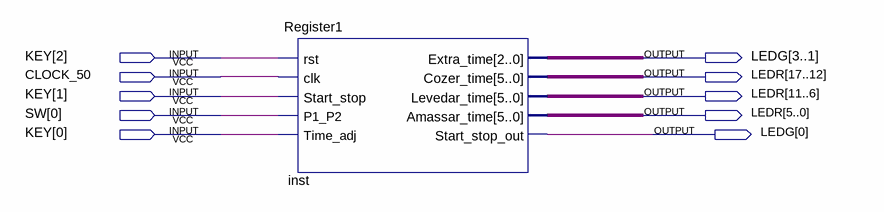
[diagram p0: schematic sheet]
// Quartus schematic Register_Demo.bdf as structural Verilog: 1 symbols, 10 pins
module Register_Demo (
  input  [2:0] KEY,
  input  CLOCK_50,
  input  [0:0] SW,
  output [3:0] LEDG,
  output [17:0] LEDR
);

  Register1 inst (
    .rst(KEY[2]), .clk(CLOCK_50), .Start_stop(KEY[1]), .P1_P2(SW[0]), .Time_adj(KEY[0]),
    .Extra_time(LEDG[3:1]), .Cozer_time(LEDR[17:12]), .Levedar_time(LEDR[11:6]), .Amassar_time(LEDR[5:0]),
    .Start_stop_out(LEDG[0]));
endmodule
